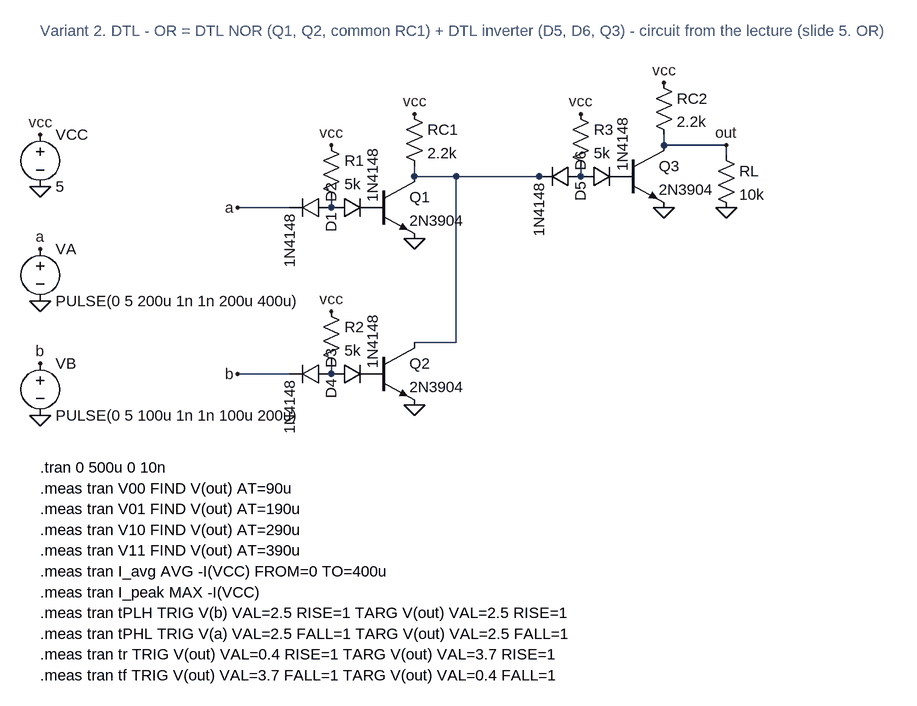
[diagram p0: schematic 2_DTL_OR.asc]
2_DTL_OR.asc, the LTspice schematic file:
Version 4
SHEET 1 1400 760
SYMBOL voltage -288 32 R0
SYMATTR InstName VCC
SYMATTR Value 5
FLAG -288 48 vcc
FLAG -288 128 0
SYMBOL voltage -288 208 R0
SYMATTR InstName VA
SYMATTR Value PULSE(0 5 200u 1n 1n 200u 400u)
FLAG -288 224 a
FLAG -288 304 0
SYMBOL voltage -288 384 R0
SYMATTR InstName VB
SYMATTR Value PULSE(0 5 100u 1n 1n 100u 200u)
FLAG -288 400 b
FLAG -288 480 0
SYMBOL diode 160 144 R90
SYMATTR InstName D1
SYMATTR Value 1N4148
WIRE 96 160 16 160
SYMBOL res 144 48 R0
SYMATTR InstName R1
SYMATTR Value 5k
FLAG 160 64 vcc
WIRE 160 144 160 160
SYMBOL diode 160 176 R270
SYMATTR InstName D2
SYMATTR Value 1N4148
SYMBOL npn 224 112 R0
SYMATTR InstName Q1
SYMATTR Value 2N3904
FLAG 288 208 0
FLAG 16 160 a
SYMBOL diode 160 400 R90
SYMATTR InstName D4
SYMATTR Value 1N4148
WIRE 96 416 16 416
SYMBOL res 144 304 R0
SYMATTR InstName R2
SYMATTR Value 5k
FLAG 160 320 vcc
WIRE 160 400 160 416
SYMBOL diode 160 432 R270
SYMATTR InstName D3
SYMATTR Value 1N4148
SYMBOL npn 224 368 R0
SYMATTR InstName Q2
SYMATTR Value 2N3904
FLAG 288 464 0
FLAG 16 416 b
SYMBOL res 272 0 R0
SYMATTR InstName RC1
SYMATTR Value 2.2k
FLAG 288 16 vcc
WIRE 288 96 288 112
WIRE 288 112 352 112
WIRE 288 368 352 368
WIRE 352 112 352 368
WIRE 352 112 480 112
SYMBOL diode 544 96 R90
SYMATTR InstName D5
SYMATTR Value 1N4148
WIRE 480 112 480 112
SYMBOL res 528 0 R0
SYMATTR InstName R3
SYMATTR Value 5k
FLAG 544 16 vcc
WIRE 544 96 544 112
SYMBOL diode 544 128 R270
SYMATTR InstName D6
SYMATTR Value 1N4148
SYMBOL npn 608 64 R0
SYMATTR InstName Q3
SYMATTR Value 2N3904
FLAG 672 160 0
SYMBOL res 656 -48 R0
SYMATTR InstName RC2
SYMATTR Value 2.2k
FLAG 672 -32 vcc
WIRE 672 48 672 64
WIRE 672 64 768 64
FLAG 768 64 out
SYMBOL res 752 64 R0
SYMATTR InstName RL
SYMATTR Value 10k
WIRE 768 64 768 80
FLAG 768 160 0
TEXT -288 -112 Left 2 ;Variant 2. DTL - OR = DTL NOR (Q1, Q2, common RC1) + DTL inverter (D5, D6, Q3) - circuit from the lecture (slide 5. OR)
TEXT -288 560 Left 2 !.tran 0 500u 0 10n
TEXT -288 592 Left 2 !.meas tran V00 FIND V(out) AT=90u
TEXT -288 624 Left 2 !.meas tran V01 FIND V(out) AT=190u
TEXT -288 656 Left 2 !.meas tran V10 FIND V(out) AT=290u
TEXT -288 688 Left 2 !.meas tran V11 FIND V(out) AT=390u
TEXT -288 720 Left 2 !.meas tran I_avg AVG -I(VCC) FROM=0 TO=400u
TEXT -288 752 Left 2 !.meas tran I_peak MAX -I(VCC)
TEXT -288 784 Left 2 !.meas tran tPLH TRIG V(b) VAL=2.5 RISE=1 TARG V(out) VAL=2.5 RISE=1
TEXT -288 816 Left 2 !.meas tran tPHL TRIG V(a) VAL=2.5 FALL=1 TARG V(out) VAL=2.5 FALL=1
TEXT -288 848 Left 2 !.meas tran tr TRIG V(out) VAL=0.4 RISE=1 TARG V(out) VAL=3.7 RISE=1
TEXT -288 880 Left 2 !.meas tran tf TRIG V(out) VAL=3.7 FALL=1 TARG V(out) VAL=0.4 FALL=1

The netlist it stands for:
* 2_DTL_OR.asc
VCC vcc 0 5
VA a 0 PULSE(0 5 200u 1n 1n 200u 400u)
VB b 0 PULSE(0 5 100u 1n 1n 100u 200u)
D1 N001 a 1N4148
R1 vcc N001 5k
D2 N001 P001 1N4148
Q1 N003 P001 0 0 2N3904
D4 N002 b 1N4148
R2 vcc N002 5k
D3 N002 P002 1N4148
Q2 N003 P002 0 0 2N3904
RC1 vcc N003 2.2k
D5 N004 N003 1N4148
R3 vcc N004 5k
D6 N004 P003 1N4148
Q3 out P003 0 0 2N3904
RC2 vcc out 2.2k
RL out 0 10k
.model D D
.lib standard.dio
.model NPN NPN
.model PNP PNP
.lib standard.bjt
* Variant 2. DTL - OR = DTL NOR (Q1, Q2, common RC1) + DTL inverter (D5, D6, Q3) - circuit from the lecture (slide 5. OR)
.tran 0 500u 0 10n
.meas tran V00 FIND V(out) AT=90u
.meas tran V01 FIND V(out) AT=190u
.meas tran V10 FIND V(out) AT=290u
.meas tran V11 FIND V(out) AT=390u
.meas tran I_avg AVG -I(VCC) FROM=0 TO=400u
.meas tran I_peak MAX -I(VCC)
.meas tran tPLH TRIG V(b) VAL=2.5 RISE=1 TARG V(out) VAL=2.5 RISE=1
.meas tran tPHL TRIG V(a) VAL=2.5 FALL=1 TARG V(out) VAL=2.5 FALL=1
.meas tran tr TRIG V(out) VAL=0.4 RISE=1 TARG V(out) VAL=3.7 RISE=1
.meas tran tf TRIG V(out) VAL=3.7 FALL=1 TARG V(out) VAL=0.4 FALL=1
.backanno
.end